# EasyEDA Pro project filter_2026-10-28.epro

# Schematic filter
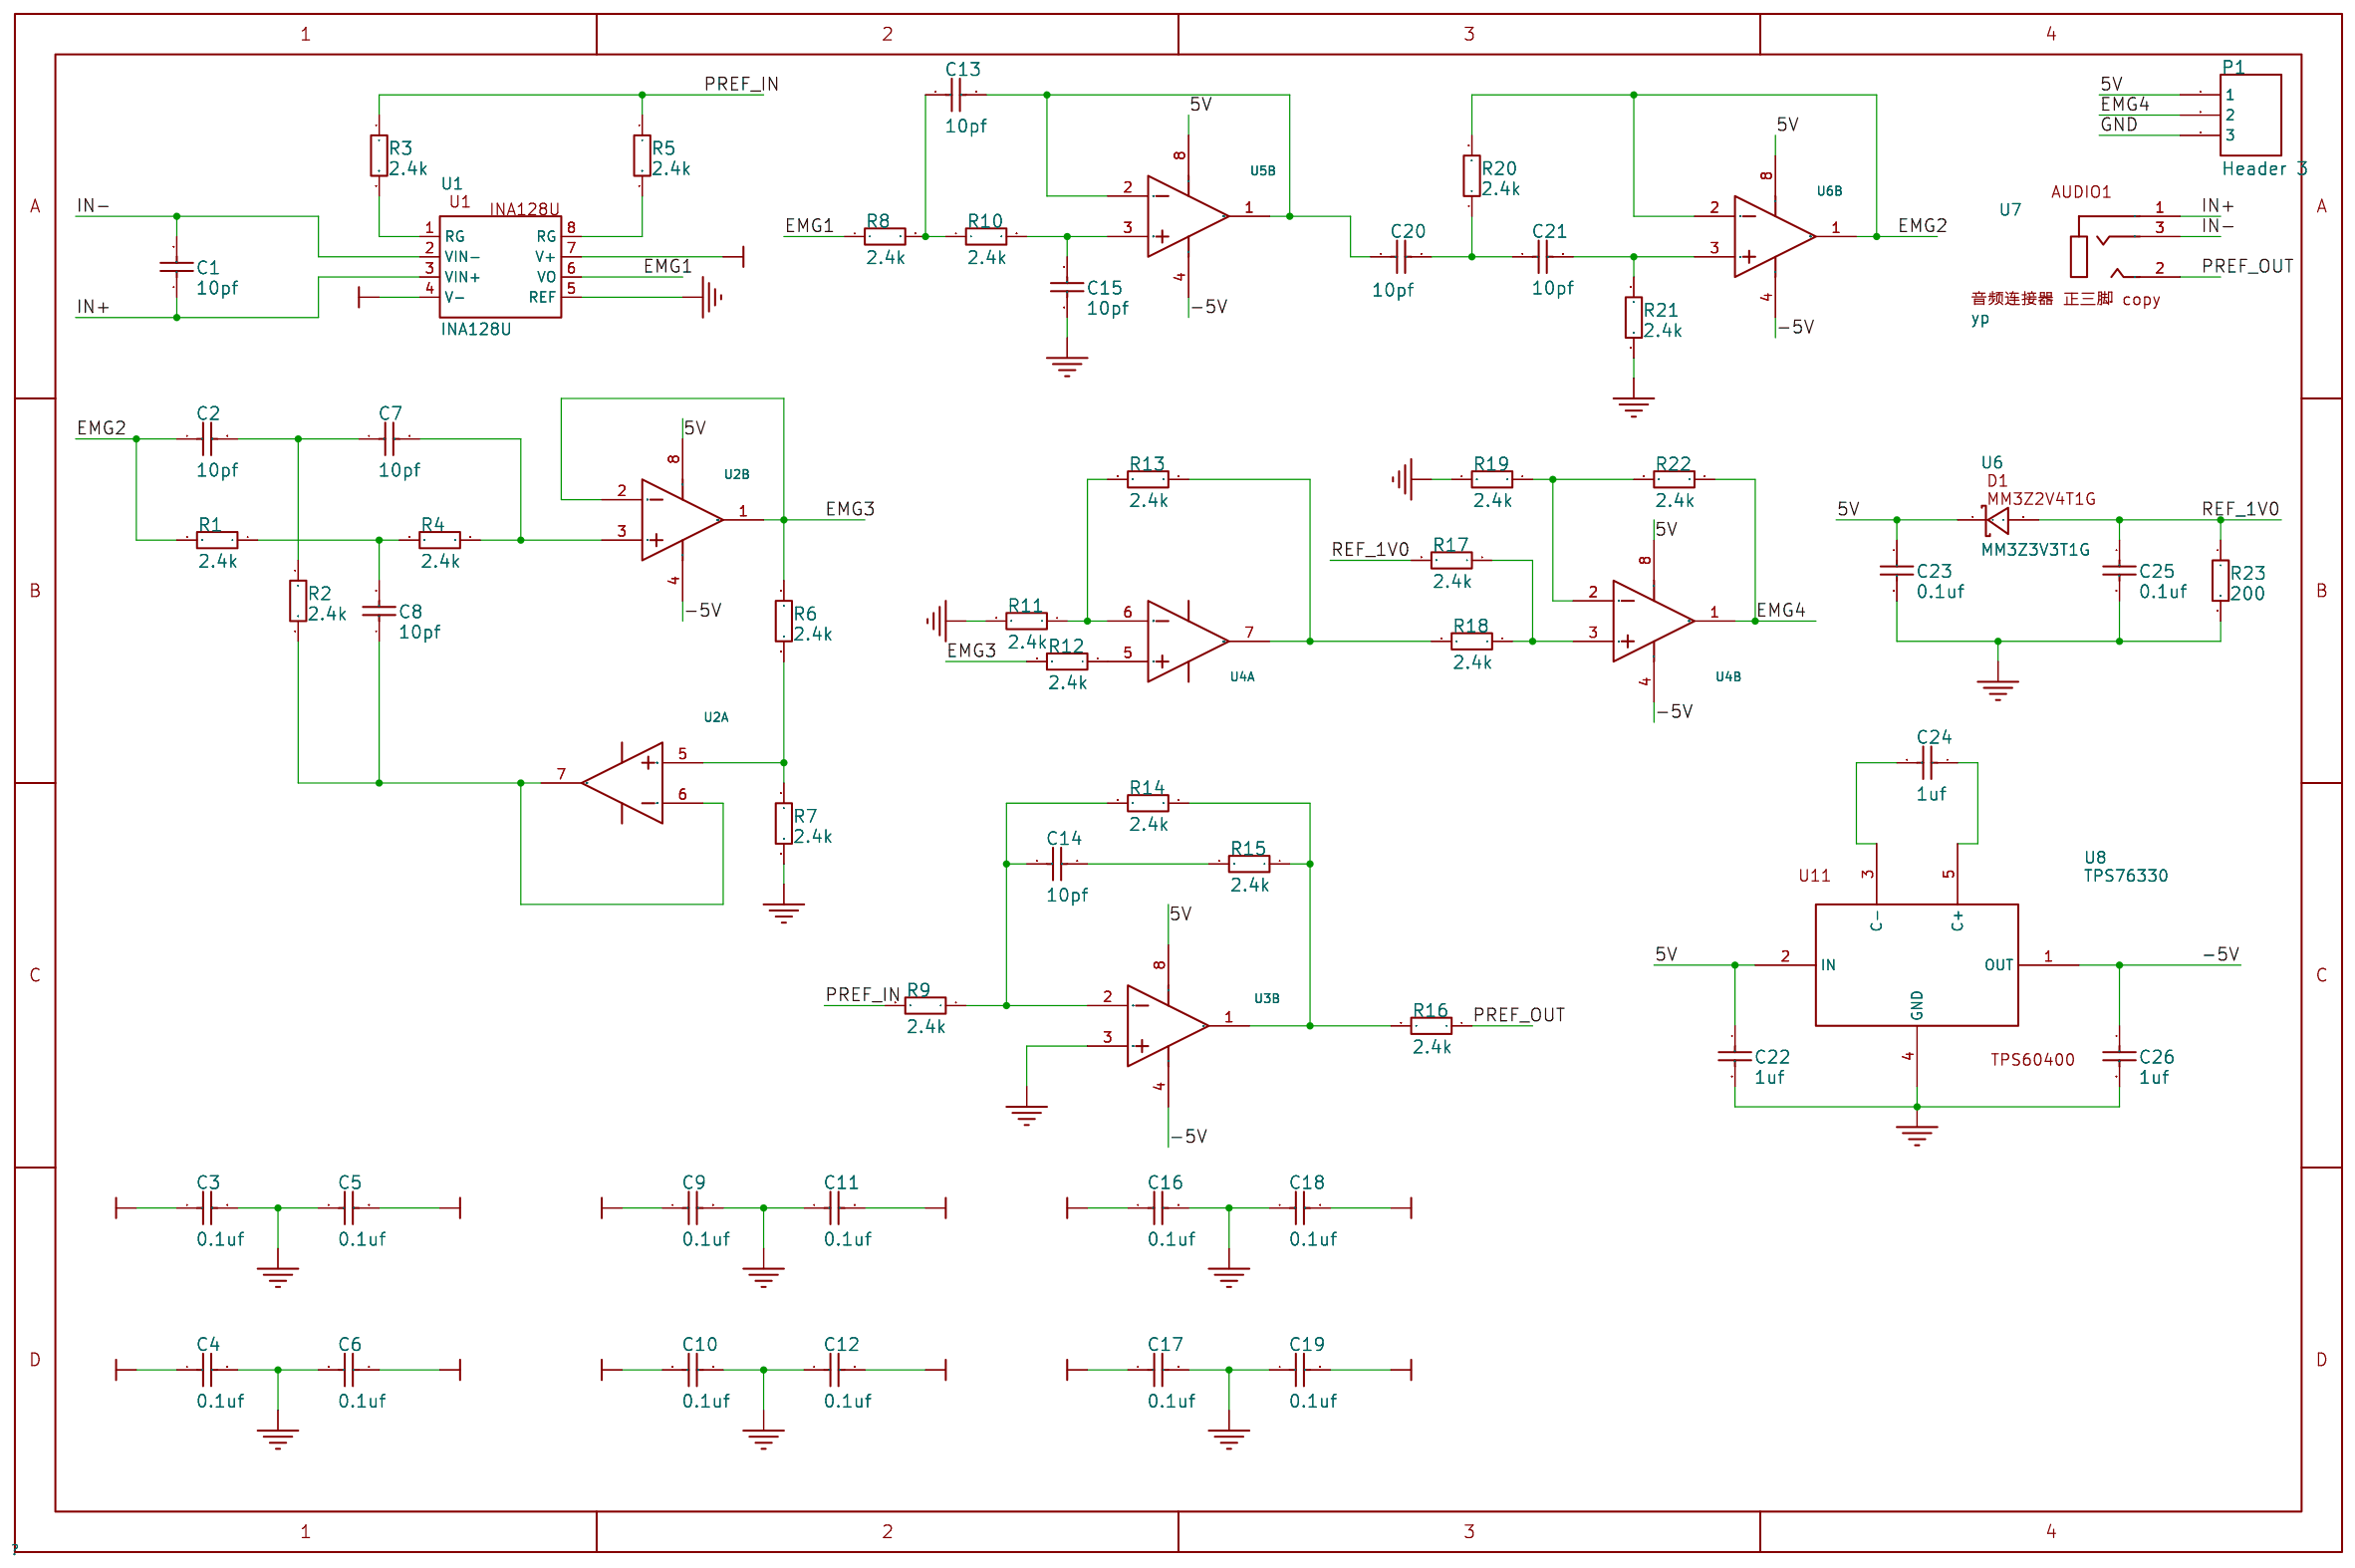
[diagram p0: schematic sheet]

## Parts
C1  10pf  [0603C]
C2  10pf  [0603C]
C3  0.1uf  [0603C]
C4  0.1uf  [0603C]
C5  0.1uf  [0603C]
C6  0.1uf  [0603C]
C7  10pf  [0603C]
C8  10pf  [0603C]
C9  0.1uf  [0603C]
C10  0.1uf  [0603C]
C11  0.1uf  [0603C]
C12  0.1uf  [0603C]
C13  10pf  [0603C]
C14  10pf  [0603C]
C15  10pf  [0603C]
C16  0.1uf  [0603C]
C17  0.1uf  [0603C]
C18  0.1uf  [0603C]
C19  0.1uf  [0603C]
C20  10pf  [0603C]
C21  10pf  [0603C]
C22  1uf  [0603C]
C23  0.1uf  [0603C]
C24  1uf  [0603C]
C25  0.1uf  [0603C]
C26  1uf  [0603C]
P1  Header 3  [3P接口]
R1  2.4k  [0603C]
R2  2.4k  [0603C]
R3  2.4k  [0603C]
R4  2.4k  [0603C]
R5  2.4k  [0603C]
R6  2.4k  [0603C]
R7  2.4k  [0603C]
R8  2.4k  [0603C]
R9  2.4k  [0603C]
R10  2.4k  [0603C]
R11  2.4k  [0603C]
R12  2.4k  [0603C]
R13  2.4k  [0603C]
R14  2.4k  [0603C]
R15  2.4k  [0603C]
R16  2.4k  [0603C]
R17  2.4k  [0603C]
R18  2.4k  [0603C]
R19  2.4k  [0603C]
R20  2.4k  [0603C]
R21  2.4k  [0603C]
R22  2.4k  [0603C]
R23  200  [0603C]
U1  INA128U  [INA128U]
U2  OPA2613ID  [SOIC-8_L4.9-W3.9-P1.27-LS6.0-BL]  (sections 1,2)
U3  OPA2613ID  [SOIC-8_L4.9-W3.9-P1.27-LS6.0-BL]  (section 2)
U4  OPA2613ID  [SOIC-8_L4.9-W3.9-P1.27-LS6.0-BL]  (sections 1,2)
U5  OPA2613ID  [SOIC-8_L4.9-W3.9-P1.27-LS6.0-BL]  (section 2)
U6  MM3Z3V3T1G  [MM3Z3V3T1G]  (section 2)
U7  yp  [YP]
U8  TPS76330  [TPS76330]

## Library data of the parts
C1-C26 = Cap_2: Capacitor; Published: 8-Jun-2000; LatestRevisionDate: 17-Jul-2002; LatestRevisionNote: Re-released for DXP Platform.; PackageReference: RAD-0.3; Publisher: Altium Limited; PackageDescription: Radial Cap, Thru-Hole; 2 Leads; 0.3 in Pin Spacing; LibraryName: PCB_Project_1
P1 = Header 3: Header, 3-Pin; LatestRevisionDate: 17-Jul-2002; LatestRevisionNote: Re-released for DXP Platform.; Publisher: Altium Limited; LibraryName: Miscellaneous Connectors
R1 R4 R9 R11-R19 R22 = RES_0805_1K_3: 贴片电阻; ComponentLink1Description: 供应商链接; ComponentLink1URL: http://www.szlcsc.com/product/details_18349.html; Package: 0805; Supplier: LC; SuppliersPartNumber: C17661; DesignItemID: RES_0805_1K; LibraryName: PCB_Project_1
R2 R3 R5-R7 R23 = RES_0805_1K: 贴片电阻; ComponentLink1Description: 供应商链接; ComponentLink1URL: http://www.szlcsc.com/product/details_18349.html; Package: 0805; Supplier: LC; SuppliersPartNumber: C17661; LibraryName: PCB_Project_1
R8 R10 = RES_0805_1K_1: 贴片电阻; ComponentLink1Description: 供应商链接; ComponentLink1URL: http://www.szlcsc.com/product/details_18349.html; Package: 0805; Supplier: LC; SuppliersPartNumber: C17661; DesignItemID: RES_0805_1K; LibraryName: PCB_Project_1
R20 R21 = RES_0805_1K_2: 贴片电阻; ComponentLink1Description: 供应商链接; ComponentLink1URL: http://www.szlcsc.com/product/details_18349.html; Package: 0805; Supplier: LC; SuppliersPartNumber: C17661; DesignItemID: RES_0805_1K; LibraryName: PCB_Project_1
U1 = INA128U: LibraryName: INA128U_2023-02-22
U2-U5 = OPA2613ID: Supplier Part: C205950; Manufacturer: TI(德州仪器); Supplier Footprint: SOIC-8; JLCPCB Part Class: Extended Part; Datasheet: https://atta.szlcsc.com/upload/public/pdf/source/20180404/C205950_504ECBD74B4D7148BA934CAA82073807.pdf; Supplier: LCSC; Number of Circuits: 2; -3db Bandwidth: 230MHz; Current - Input Bias(Ib): 6uA; Voltage - Input Offset(Vos): 200uV; Gain Bandwidth Product(GBP): 125MHz; Slew Rate(SR): 70V/us; Supply Current: 12mA; LibraryName: OPA2613ID1_OPA2613ID
U6 = MM3Z3V3T1G: LibraryName: MM3Z3V3T1G_2023-02-22
U7 = yp: LibraryName: yp_2023-02-22
U8 = TPS76330: LibraryName: TPS76330_2023-02-22

## Nets
5V: C2.1 C3.1 C4.1 C9.1 C10.1 C16.1 C17.1 C22.1 C23.1 C25.1 P1.1 R1.2 R17.2 R20.2 R23.1 U1.7(V+) U2.8(VS+) U3.8(VS+) U4.8(VS+) U5.8(VS+) U6.1(OUT A) U6.2(IN A-) U6.8(VS+) U8.2(IN)
-5V: C5.2 C6.2 C11.2 C12.2 C18.2 C19.2 C26.1 U1.4(V-) U2.4(VS-) U3.4(VS-) U4.4(VS-) U5.4(VS-) U6.4(VS-) U8.1(OUT)
GND: C3.2 C4.2 C5.1 C6.1 C9.2 C10.2 C11.1 C12.1 C15.2 C16.2 C17.2 C18.1 C19.1 C22.2 C23.2 C25.2 C26.2 P1.3 R7.2 R11.2 R19.2 R21.1 R23.2 U1.5(REF) U3.3(IN A+) U8.4(GND)
EMG1: R8.1 U1.6(VO)
EMG3: R6.1 R12.2 U2.1(OUT A) U2.2(IN A-)
EMG4: P1.2 R22.1 U4.1(OUT A)
IN+: C1.1 U1.3(VIN+) U7.1
IN-: C1.2 U1.2(VIN-) U7.3
PREF_IN: R3.1 R5.1 R9.2
PREF_OUT: R16.1 U7.2
Net-(C2-2): C2.2 C7.1 R2.1
Net-(C7-2): C7.2 R4.1 U2.3(IN A+)
Net-(C8-1): C8.1 R2.2 U2.6(IN B-) U2.7(OUT B)
Net-(C8-2): C8.2 R1.1 R4.2
Net-(C13-1): C13.1 R8.2 R10.1
Net-(C13-2): C13.2 C20.1 U5.1(OUT A) U5.2(IN A-)
Net-(C14-1): C14.1 R9.1 R14.2 U3.2(IN A-)
Net-(C14-2): C14.2 R15.2
Net-(C15-1): C15.1 R10.2 U5.3(IN A+)
Net-(C20-2): C20.2 C21.1 R20.1
Net-(C21-2): C21.2 R21.2 U6.3(IN A+)
Net-(C24-1): C24.1 U8.5(C+)
Net-(C24-2): C24.2 U8.3(C-)
Net-(R3-2): R3.2 U1.1(RG)
Net-(R5-2): R5.2 U1.8(RG)
Net-(R6-2): R6.2 R7.1 U2.5(IN B+)
Net-(R11-1): R11.1 R13.2 U4.6(IN B-)
Net-(R12-1): R12.1 U4.5(IN B+)
Net-(R13-1): R13.1 R18.2 U4.7(OUT B)
Net-(R14-1): R14.1 R15.1 R16.2 U3.1(OUT A)
Net-(R17-1): R17.1 R18.1 U4.3(IN A+)
Net-(R19-1): R19.1 R22.2 U4.2(IN A-)

# Board filter
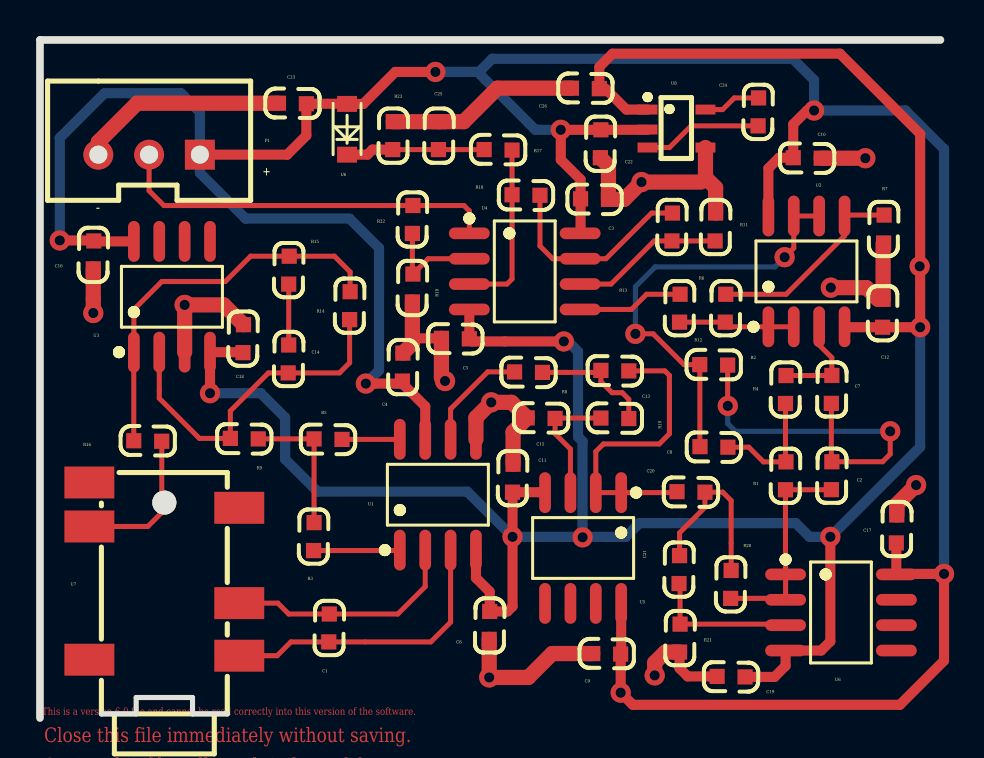
[diagram p1: board, top side]
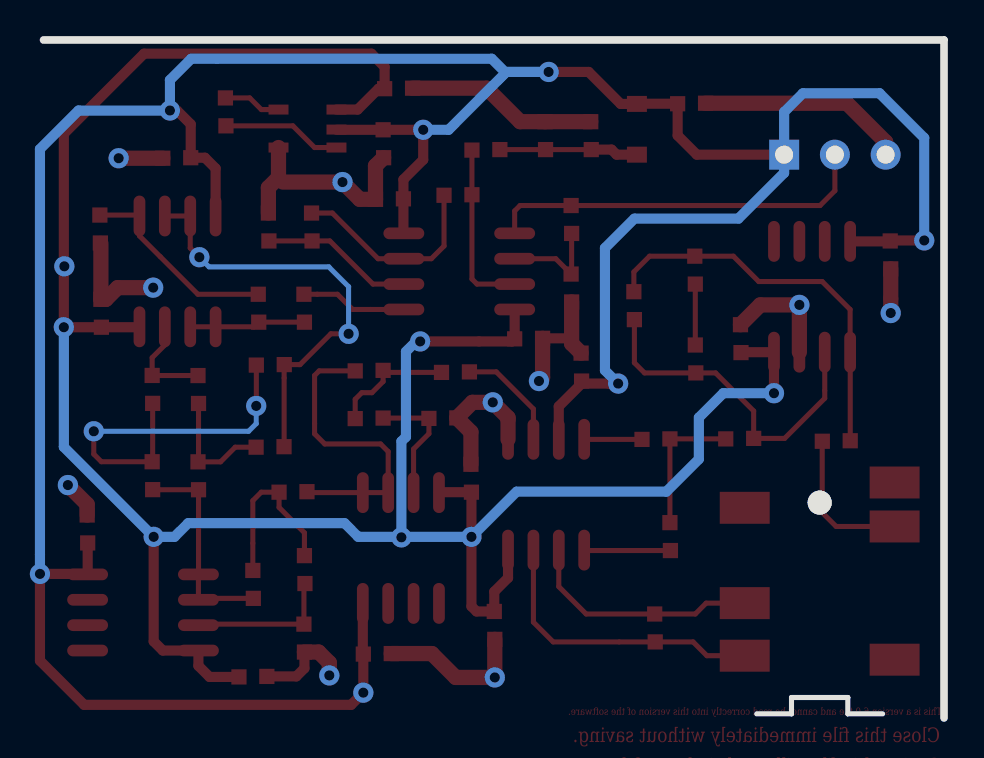
[diagram p2: board, bottom side, seen from below]

Outline 45.06 x 33.93 mm; copper layers: Top Layer, Mid-Layer 1, Internal Plane 1, Mid-Layer 2, Internal Plane 2, Mid-Layer 3, Internal Plane 3, Mid-Layer 4, Internal Plane 4, Mid-Layer 5, Internal Plane 5, Mid-Layer 6, Internal Plane 6, Mid-Layer 7, Internal Plane 7, Mid-Layer 8, Internal Plane 8, Mid-Layer 9, Internal Plane 9, Mid-Layer 10, Internal Plane 10, Mid-Layer 11, Internal Plane 11, Mid-Layer 12, Internal Plane 12, Mid-Layer 13, Internal Plane 13, Mid-Layer 14, Internal Plane 14, Mid-Layer 15, Internal Plane 15, Bottom Layer. Coordinates in mm from the lower left corner of the outline.
Outline path: 45.06,33.93 0,33.93 0,0
Stack: Top Layer 0.0356mm / Dielectric 1 0.32mm FR-4 er 4.8 / Bottom Layer 0.0356mm

## Design rules (mm)
spacing Clearance (default): track to track 0.152, other pairs 0.152 to 0.3
track width Width (default): min 0.152, default 0.178, max 2.54
differential pair DiffPairsRouting (default): width min 0.381, default 0.381, max 0.381; gap min 0.254, default 0.254

## Placement (name value [footprint] x y rotation side)
C1  10pf  [0603C]  14.44 3.8 90 top
C2  10pf  [0603C]  39.59 11.42 90 top
C3  0.1uf  [0603C]  27.05 25.99 0 top
C4  0.1uf  [0603C]  18.13 16.86 90 top
C5  0.1uf  [0603C]  20.08 19.01 0 top
C6  0.1uf  [0603C]  22.47 3.93 90 top
C7  10pf  [0603C]  39.59 15.74 90 top
C8  10pf  [0603C]  33.02 13.59 0 top
C9  0.1uf  [0603C]  29.06 3.19 180 top
C10  0.1uf  [0603C]  37.69 28.05 0 top
C11  0.1uf  [0603C]  23.68 12.71 270 top
C12  0.1uf  [0603C]  42.2 20.96 270 top
C13  10pf  [0603C]  28.06 17.41 0 top
C14  10pf  [0603C]  12.41 17.27 90 top
C15  10pf  [0603C]  25.78 14.99 180 top
C16  0.1uf  [0603C]  2.7 23.88 270 top
C17  0.1uf  [0603C]  42.84 8.76 90 top
C18  0.1uf  [0603C]  10.19 19.69 270 top
C19  0.1uf  [0603C]  33.88 2.09 0 top
C20  10pf  [0603C]  31.87 11.34 0 top
C21  10pf  [0603C]  32.01 8.13 270 top
C22  1uf  [0603C]  28.08 29.44 270 top
C23  0.1uf  [0603C]  13.34 30.73 180 top
C24  1uf  [0603C]  35.97 31.04 270 top
C25  0.1uf  [0603C]  19.93 28.44 90 top
C26  1uf  [0603C]  28 31.49 180 top
P1  Header 3  [3P接口]  5.46 28.19 0 top
R1  2.4k  [0603C]  37.34 12.83 270 top
R2  2.4k  [0603C]  34.42 17.65 180 top
R3  2.4k  [0603C]  13.72 9.78 270 top
R4  2.4k  [0603C]  37.34 17.14 270 top
R5  2.4k  [0603C]  13.71 13.98 0 top
R6  2.4k  [0603C]  34.28 19.81 90 top
R7  2.4k  [0603C]  42.25 25.18 270 top
R8  2.4k  [0603C]  23.74 17.33 0 top
R9  2.4k  [0603C]  9.52 14 0 top
R10  2.4k  [0603C]  29.47 14.98 180 top
R11  2.4k  [0603C]  33.77 23.87 90 top
R12  2.4k  [0603C]  32.04 21.21 270 top
R13  2.4k  [0603C]  31.66 25.28 270 top
R14  2.4k  [0603C]  15.53 21.34 270 top
R15  2.4k  [0603C]  12.48 23.12 270 top
R16  2.4k  [0603C]  6.1 13.84 180 top
R17  2.4k  [0603C]  23.63 28.41 180 top
R18  2.4k  [0603C]  23.62 26.2 0 top
R19  2.4k  [0603C]  18.67 22.22 270 top
R20  2.4k  [0603C]  34.59 7.39 270 top
R21  2.4k  [0603C]  32 3.3 90 top
R22  2.4k  [0603C]  18.67 25.65 270 top
R23  200  [0603C]  17.64 28.44 90 top
U1  -  [INA128U]  19.81 11.18 0 top
U2  OPA2613ID  [SOIC-8_L4.9-W3.9-P1.27-LS6.0-BL]  38.35 22.35 0 top
U3  OPA2613ID  [SOIC-8_L4.9-W3.9-P1.27-LS6.0-BL]  6.6 21.08 0 top
U4  OPA2613ID  [SOIC-8_L4.9-W3.9-P1.27-LS6.0-BL]  24.26 22.35 270 top
U5  OPA2613ID  [SOIC-8_L4.9-W3.9-P1.27-LS6.0-BL]  27.18 8.51 180 top
U6  -  [MM3Z3V3T1G]  15.37 29.46 270 top
U6#2  -  [SOIC-8_L4.9-W3.9-P1.27-LS6.0-BL]  40.08 5.28 270 top
U7  yp  [YP]  6.22 5.33 0 top
U8  -  [TPS76330]  31.85 29.54 0 top

## Footprints (pads in the part's own frame, mm; a bottom-side part is the same pattern mirrored in y, then rotated)
3P接口
  rect 1.5x1.5 hole 0.9: 1(2.54,0)
  round 1.5 hole 0.9: 2(0,0) 3(-2.54,0)
0603C
  rect 0.762x0.762 smd: 1(0.005,-0.009) 2(1.403,-0.035)
INA128U
  oval 0.588x2.045 smd: 1(-1.806,-2.772) 2(-0.535,-2.772) 3(0.735,-2.772) 4(2.005,-2.772) 5(2.005,2.772) 6(0.735,2.772) 7(-0.535,2.772) 8(-1.806,2.772)
MM3Z3V3T1G
  round 0.001 smd: 1(-1.27,0) 2(1.27,0)
SOIC-8_L4.9-W3.9-P1.27-LS6.0-BL
  oval 0.588x2.045 smd: 1(-1.905,-2.772) 2(-0.635,-2.772) 3(0.635,-2.772) 4(1.905,-2.772) 5(1.905,2.772) 6(0.635,2.772) 7(-0.635,2.772) 8(-1.905,2.772)
TPS76330
  round 0.001 smd: 1(-1.45,0.91) 2(-1.45,-0.089) 3(-1.45,-0.99) 4(1.45,-0.99) 5(1.45,0.91)
YP
  round 1.2 hole 1.2: (0,5.447)
  rect 2.5x1.6 smd: 1(3.75,-2.215) 2(-3.75,4.253) 3(3.75,0.416) 4(-3.75,-2.414) 5(-3.75,6.454) 6(3.75,5.186)

## Nets
5V: C3.1 C4.1 C9.1 C10.1 C16.1 C17.1 C22.1 C23.1 P1.1 U1.7 U2.8 U3.8 U4.8 U5.8 U6.1 U6#2.8 U8.2
-5V: C5.2 C6.2 C11.2 C12.2 C18.2 C19.2 C26.1 U1.4 U2.4 U3.4 U4.4 U5.4 U6#2.4 U8.1
GND: C3.2 C4.2 C5.1 C6.1 C9.2 C10.2 C11.1 C12.1 C15.2 C16.2 C17.2 C18.1 C19.1 C22.2 C23.2 C25.2 C26.2 P1.3 R7.2 R11.2 R19.2 R21.1 R23.2 U1.5 U3.3 U8.4
EMG1: R8.1 U1.6
EMG2: C2.1 R1.2 R20.2 U6#2.1 U6#2.2
EMG3: R6.1 R12.2 U2.1 U2.2
EMG4: P1.2 R22.1 U4.1
IN+: C1.1 U1.3 U7.1
IN-: C1.2 U1.2 U7.3
NetC2_2: C2.2 C7.1 R2.1
NetC7_2: C7.2 R4.1 U2.3
NetC8_1: C8.1 R2.2 U2.6 U2.7
NetC8_2: C8.2 R1.1 R4.2
NetC13_1: C13.1 R8.2 R10.1
NetC13_2: C13.2 C20.1 U5.1 U5.2
NetC14_1: C14.1 R9.1 R14.2 U3.2
NetC14_2: C14.2 R15.2
NetC15_1: C15.1 R10.2 U5.3
NetC20_2: C20.2 C21.1 R20.1
NetC21_2: C21.2 R21.2 U6#2.3
NetC24_1: C24.1 U8.5
NetC24_2: C24.2 U8.3
NetR3_2: R3.2 U1.1
NetR5_2: R5.2 U1.8
NetR6_2: R6.2 R7.1 U2.5
NetR11_1: R11.1 R13.2 U4.6
NetR12_1: R12.1 U4.5
NetR13_1: R13.1 R18.2 U4.7
NetR14_1: R14.1 R15.1 R16.2 U3.1
NetR17_1: R17.1 R18.1 U4.3
NetR19_1: R19.1 R22.2 U4.2
PREF_IN: R3.1 R5.1 R9.2
PREF_OUT: R16.1 U7.2
REF_1V0: C25.1 R17.2 R23.1 U6.2

Pads without a net: U3 5 6 7; U5 5 6 7; U6#2 5 6 7; U7 4 5 6

## Via types
v1: diameter 1.016, hole 0.508, Top Layer to Bottom Layer, 28 vias

## Routing (per net, layer and track width the routed paths; a pad name or vN(x,y) marks a point on that pad's centre or on a via; arc(x,y) is an arc through that point)
5V:
  vias: v1(0.99,23.9) v1(16.31,16.74) v1(19.79,32.33) v1(26.06,29.44) v1(29.06,1.27) v1(38.73,30.4) v1(45.24,7.21)
-5V:
  vias: v1(8.51,16.26) v1(23.65,9.07) v1(26.21,18.85) v1(27.15,9.04) v1(39.55,9.07) v1(44.02,22.61) v1(44.04,19.56)
GND:
  vias: v1(2.67,20.27) v1(7.24,20.68) v1(20.27,16.87) v1(22.48,2.03) v1(22.58,15.8) v1(30.1,26.82) v1(30.76,2.13) v1(39.57,21.54) v1(41.3,28.02) v1(43.84,11.66)
(no net): length 644
  Top Layer w0.254: 34.41,15.63 34.41,17.66 ; 33.02,13.59 33.02,17.68 ; 39.62,17.14 39.62,18.03 38.99,18.67 38.99,19.58 ; 22.22,28.45 19.94,28.45 17.65,28.45 ; 13.69,8.38 17.98,8.38 ; 4.7,18.31 4.7,20.45 6.1,21.84 9.27,21.84 10.54,23.11 12.47,23.11 14.73,23.11 15.52,22.33 15.52,21.34 ; 29.79,19.23 30.68,19.23 32.22,17.69 33.01,17.69 ; 33.3,30.45 34.16,30.45 34.74,31.03 35.96,31.03 ; 19.28,8.4 19.28,6.58 17.91,5.21 14.48,5.21 12.45,5.21 11.9,5.75 9.97,5.75 ; 32,8.13 32,9.27 33.27,10.54 33.27,11.3 34.16,11.3 34.59,10.88 34.59,7.39 ; 37.3,12.85 37.3,15.74 ; 20.55,8.4 20.55,4.8 19.56,3.81 14.45,3.81 12.56,3.81 11.87,3.12 9.97,3.12 ; 28.07,15.01 25.79,15.01 25.78,14.99 25.78,14.23 26.54,13.46 26.54,12.04 ; 37.33,12.82 36.2,12.82 35.47,13.55 34.42,13.55 ; 29.46,14.99 29.46,15.95 29.13,16.28 28.63,16.28 28.07,16.84 28.07,17.4 27.97,17.3 25.15,17.3 ; 35.93,29.64 32.58,29.64 31.5,28.55 30.4,28.55 ; 32,19.81 34.29,19.81 34.52,19.58 36.45,19.58 37.72,19.58 ; 39.62,12.83 42.16,12.83 42.54,13.21 42.54,14.35 ; 29.46,17.37 31.27,17.37 31.5,17.14 31.5,14.22 30.99,13.72 28.19,13.72 27.81,13.33 27.81,12.04 ; 13.72,9.78 13.72,13.97 10.92,13.97 ; 5.46,28.19 5.46,26.39 6.2,25.65 18.66,25.65 21.21,25.65 21.48,25.38 21.48,24.26 ; 37.31,5.92 37.31,7.19 37.3,7.19 37.3,11.42 39.59,11.42 ; 33.78,23.88 31.62,23.88 30.73,23.88 28.57,21.72 27.03,21.72 ; 25.02,26.16 25.02,23.62 25.65,22.99 27.03,22.99 28.32,22.99 30.61,25.27 31.65,25.27 ; 18.63,24.25 18.63,22.24 18.66,22.22 19.43,22.99 21.48,22.99 ; 12.45,18.67 12.45,21.72 ; 2.47,9.59 5.4,9.59 6.1,10.28 6.1,13.85 ; 34.56,5.99 37.24,5.99 ; 32.03,21.21 30.35,21.21 29.59,20.45 27.03,20.45 ; 40.31,25.17 42.24,25.17 ; 15.36,30.74 15.37,30.73 ; 15.11,13.94 18,13.94 ; 21.48,21.72 23.37,21.72 23.62,21.97 23.62,26.19 23.62,28.42 ; 34.32,21.21 37.34,21.21 40.26,24.13 40.26,25.12 ; 37.26,23.06 37.72,23.52 37.72,25.12 38.99,25.12 ; 31.83,11.28 29.08,11.28 27.81,11.28 ; 2.69,23.88 2.71,23.85 ; 15.49,19.94 15.49,17.78 14.99,17.27 12.42,17.27 11.43,17.27 9.53,15.37 9.53,14 7.98,14 5.97,16 5.97,18.31 ; 37.33,17.14 39.62,17.14 ; 39.6,12.85 39.6,15.75 ; 32.03,6.68 32.03,4.7 37.26,4.7 37.31,4.65 ; 23.75,17.32 22.4,17.32 20.55,15.47 20.55,13.95
  Top Layer w0.508: 0.99,23.9 2.67,23.9 ; 18.14,16.74 18.14,16.87 ; 18.14,16.74 19.28,15.6 19.28,13.74 ; 18.14,16.74 16.31,16.74 ; 8,28.19 12.37,28.19 13.33,29.15 13.33,30.74 15.36,30.74 ; 29.08,3.23 29.08,5.74 ; 29.06,3.2 29.06,1.27 29.67,0.66 43.03,0.66 45.24,2.87 45.24,7.21 42.87,7.21 42.85,7.19 42.85,8.76 ; 42.85,7.19 42.88,7.21 ; 21.82,8.4 21.82,7.01 22.5,6.32 22.5,5.33 23.39,5.33 23.65,5.59 23.65,11.3 25.25,11.3 25.27,11.28 ; 18.75,19.08 18.82,19 20.09,19 ; 30.39,29.44 28.07,29.44 26.06,29.44 26.06,27.94 27.05,26.95 27.05,25.98 ; 10.14,18.31 8.51,18.31 8.51,16.26 ; 38.73,30.4 38.38,30.4 37.69,29.72 37.69,28.04 36.98,28.04 36.45,27.51 36.45,25.12 ; 19.79,32.33 17.78,32.33 16.18,30.73 15.37,30.73 ; 35.28,2.06 36.75,2.06 37.31,2.61 37.31,3.38 39.09,3.38 39.55,3.84 39.55,9.07 ; 27.03,24.26 27.05,24.28 27.05,25.83 ; 32,3.3 32,2.49 32.41,2.08 33.88,2.08 ; 15.37,28.19 16.38,28.19 16.64,28.45 17.65,28.45 ; 40.28,19.56 42.16,19.56 44.04,19.56 44.04,29.24 40.03,33.25 28.65,33.25 27.99,32.59 27.99,31.5 28.3,31.5 29.34,30.45 30.4,30.45 ; 21.48,20.45 21.48,18.98 21.62,18.85 26.21,18.85 ; 2.71,23.85 4.7,23.85
  Top Layer w0.762: 2.92,28.19 2.92,28.83 4.86,30.77 11.93,30.77 ; 30.76,2.13 30.76,2.77 31.29,3.3 32,3.3 ; 43.84,11.66 42.88,10.69 42.88,10.16 ; 42.19,23.75 42.19,20.95 41.94,20.95 41.35,21.54 39.57,21.54 ; 21.82,13.95 21.82,15.03 22.58,15.8 23.6,15.8 24.38,15.02 23.67,14.31 23.67,12.7 ; 7.24,18.31 7.24,20.68 9.19,20.68 10.19,19.68 ; 18.63,20.82 18.63,18.74 18.16,18.26 ; 33.07,26.82 30.1,26.82 29.24,25.96 28.45,25.96 28.45,27.63 28.04,28.04 ; 2.67,20.27 2.67,22.48 ; 39.09,28.02 41.3,28.02 ; 33.81,25.27 33.81,26.54 33.3,27.05 33.3,28.55 ; 26.59,31.52 22.89,31.52 21.21,29.84 19.96,29.84 17.68,29.84 ; 20.27,16.87 20.09,17.05 20.09,19 ; 27.66,3.23 25.63,3.23 24.44,2.03 22.48,2.03 22.48,3.94
  Bottom Layer w0.254: 42.54,14.35 34.8,14.35 34.42,14.73 34.42,15.62 ; 37.26,23.06 36.78,22.58 30.78,22.58 29.79,21.59 29.79,19.23
  Bottom Layer w0.508: 19.79,32.33 21.89,32.33 24.79,29.44 26.06,29.44 ; 8.51,16.26 11.05,16.26 12.27,15.04 12.27,12.95 13.89,11.33 21.39,11.33 23.65,9.07 29.31,9.07 30,9.75 37.82,9.75 38.51,9.07 39.55,9.07 44.04,13.56 44.04,19.56 ; 27.15,9.04 27.15,13.84 26.92,14.07 26.92,18.34 26.42,18.85 26.21,18.85 ; 0.99,23.9 0.99,29.03 3.23,31.27 7.06,31.27 8,30.33 8,28.19 8,27.28 10.29,24.99 15.49,24.99 16.97,23.52 16.97,17.4 16.31,16.74 ; 19.91,32.33 21.97,32.33 22.63,32.99 37.67,32.99 38.73,31.93 38.73,30.4 43.31,30.4 45.24,28.47 45.24,7.21
NetC2_2:
  vias: v1(34.42,15.62) v1(42.54,14.35)
NetC8_1:
  vias: v1(29.79,19.23) v1(37.26,23.06)
NetR14_1: length 3.8
  Top Layer w0.254: R16.2 4.69,17.68

## Text on the board
Top Layer: This is a version 6.0 file and cannot be read correctly into this version of the software. | Close this file immediately without saving. | Saving this file will result in loss of data.
Top Silkscreen Layer: - | +
